# EasyEDA Pro project iamdt-guang-chui-60-40a2c53b.epro, schematic Schematic1_1
Board Name: Board1; Create Date: 2024-08-25
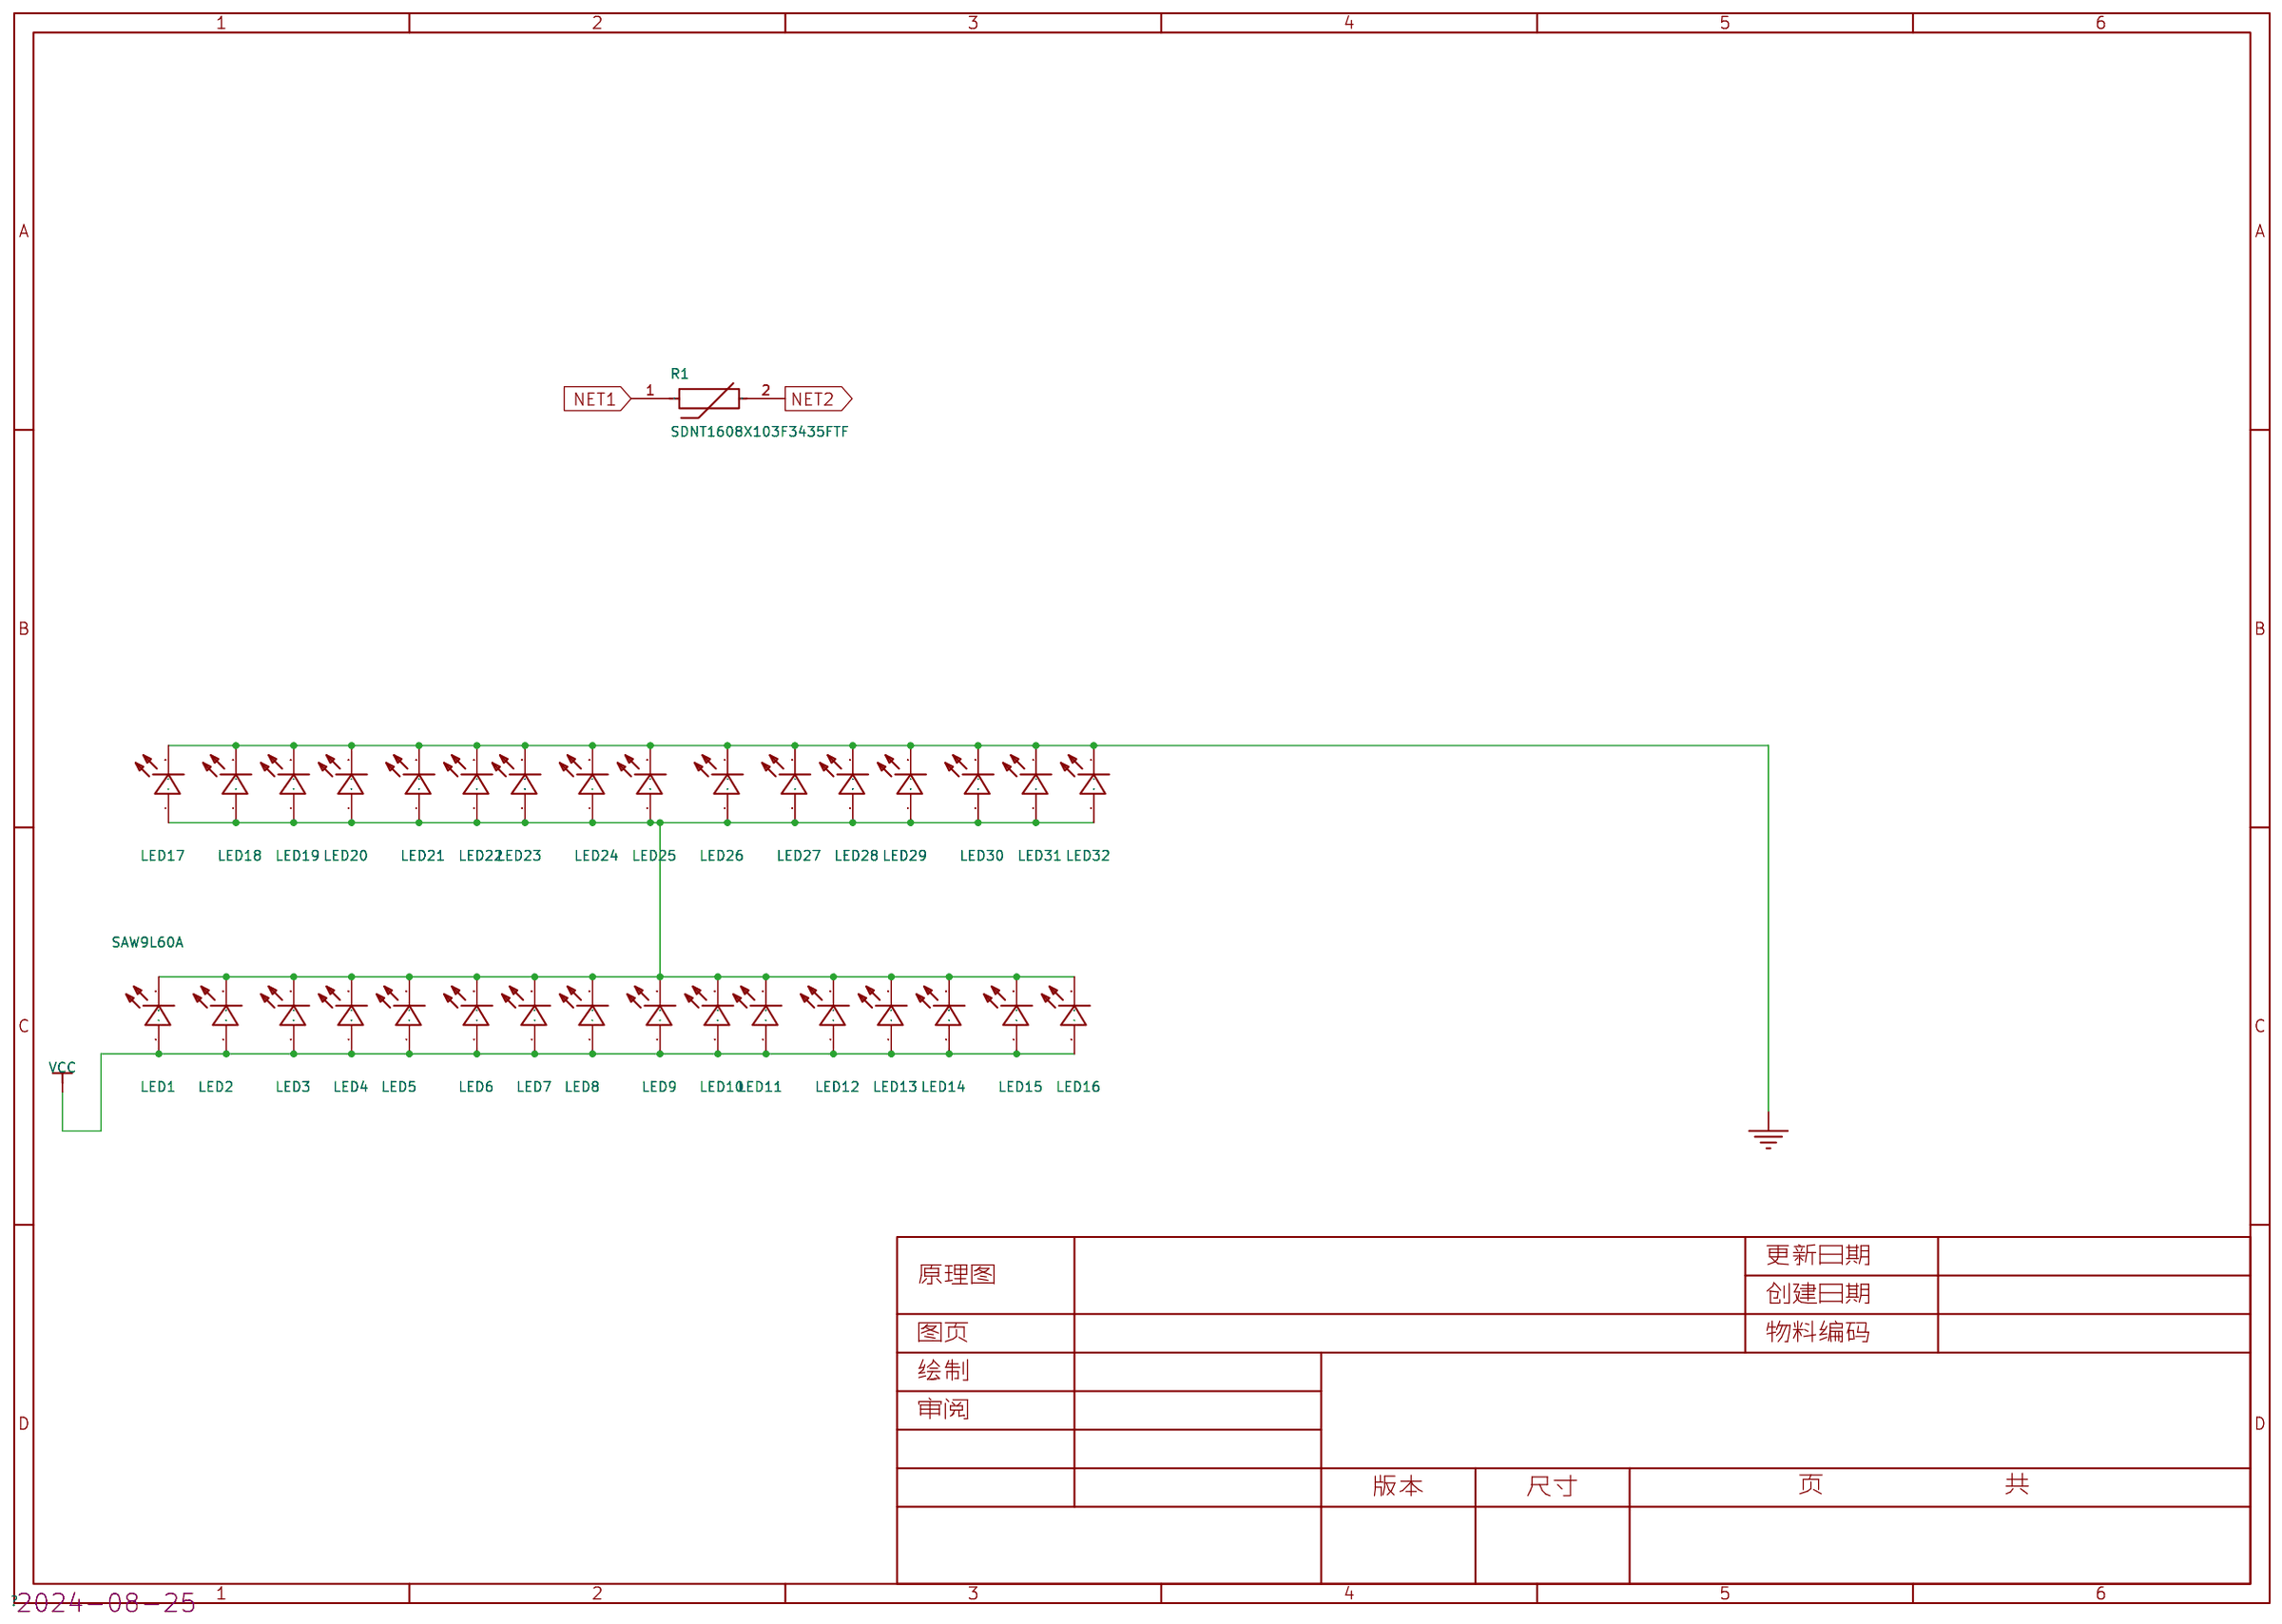
[diagram p1: schematic sheet]

## Parts
LED1  SAW9L60A  [emc5050-1]
LED2  SAW9L60A  [emc5050-1]
LED3  SAW9L60A  [emc5050-1]
LED4  SAW9L60A  [emc5050-1]
LED5  SAW9L60A  [emc5050-1]
LED6  SAW9L60A  [emc5050-1]
LED7  SAW9L60A  [emc5050-1]
LED8  SAW9L60A  [emc5050-1]
LED9  SAW9L60A  [emc5050-1]
LED10  SAW9L60A  [emc5050-1]
LED11  SAW9L60A  [emc5050-1]
LED12  SAW9L60A  [emc5050-1]
LED13  SAW9L60A  [emc5050-1]
LED14  SAW9L60A  [emc5050-1]
LED15  SAW9L60A  [emc5050-1]
LED16  SAW9L60A  [emc5050-1]
LED17  SAW9L60A  [emc5050-1]
LED18  SAW9L60A  [emc5050-1]
LED19  SAW9L60A  [emc5050-1]
LED20  SAW9L60A  [emc5050-1]
LED21  SAW9L60A  [emc5050-1]
LED22  SAW9L60A  [emc5050-1]
LED23  SAW9L60A  [emc5050-1]
LED24  SAW9L60A  [emc5050-1]
LED25  SAW9L60A  [emc5050-1]
LED26  SAW9L60A  [emc5050-1]
LED27  SAW9L60A  [emc5050-1]
LED28  SAW9L60A  [emc5050-1]
LED29  SAW9L60A  [emc5050-1]
LED30  SAW9L60A  [emc5050-1]
LED31  SAW9L60A  [emc5050-1]
LED32  SAW9L60A  [emc5050-1]
R1  SDNT1608X103F3435FTF  [R0603]

## Library data of the parts
LED1-LED32 = KT-0805W: 色温6000K左右; LCSC Part Name: 0805 白灯 高亮; Supplier Part: C34499; Manufacturer: KENTO; Supplier Footprint: 0805; JLCPCB Part Class: 基础库; Datasheet: https://atta.szlcsc.com/upload/public/pdf/source/20221124/DAA20402FFC1FB071B8B6797757426FE.pdf; Supplier: LCSC
R1 = SDNT1608X103F3435FTF: 阻值(25℃):10kΩ;B值(25℃/50℃):3435K;电阻精度:±1%;功率:-;B值精度:±1%;最大稳态电流(25℃):-;; LCSC Part Name: 10kΩ 电阻精度:±1% 3435K; Supplier Part: C525660; Manufacturer: Sunlord(顺络); Supplier Footprint: 0603; JLCPCB Part Class: 扩展库; Datasheet: https://atta.szlcsc.com/upload/public/pdf/source/20210916/BF106A3565EDFEB141CB3E0EA3A661F8.pdf; Supplier: LCSC; Resistance @ 25℃: 10kΩ; B Constant (25℃/50℃): 3435K; Resistance Tolerance: ±1%; B Constant Tolerance: ±1%; Operating Temperature: -55℃~+125℃

## Nets
GND: LED17.2(K) LED18.2(K) LED19.2(K) LED20.2(K) LED21.2(K) LED22.2(K) LED23.2(K) LED24.2(K) LED25.2(K) LED26.2(K) LED27.2(K) LED28.2(K) LED29.2(K) LED30.2(K) LED31.2(K) LED32.2(K)
VCC: LED1.1(A) LED2.1(A) LED3.1(A) LED4.1(A) LED5.1(A) LED6.1(A) LED7.1(A) LED8.1(A) LED9.1(A) LED10.1(A) LED11.1(A) LED12.1(A) LED13.1(A) LED14.1(A) LED15.1(A) LED16.1(A)
NET1: R1.1
NET2: R1.2
Net-(LED1-2): LED1.2(K) LED2.2(K) LED3.2(K) LED4.2(K) LED5.2(K) LED6.2(K) LED7.2(K) LED8.2(K) LED9.2(K) LED10.2(K) LED11.2(K) LED12.2(K) LED13.2(K) LED14.2(K) LED15.2(K) LED16.2(K) LED17.1(A) LED18.1(A) LED19.1(A) LED20.1(A) LED21.1(A) LED22.1(A) LED23.1(A) LED24.1(A) LED25.1(A) LED26.1(A) LED27.1(A) LED28.1(A) LED29.1(A) LED30.1(A) LED31.1(A) LED32.1(A)
